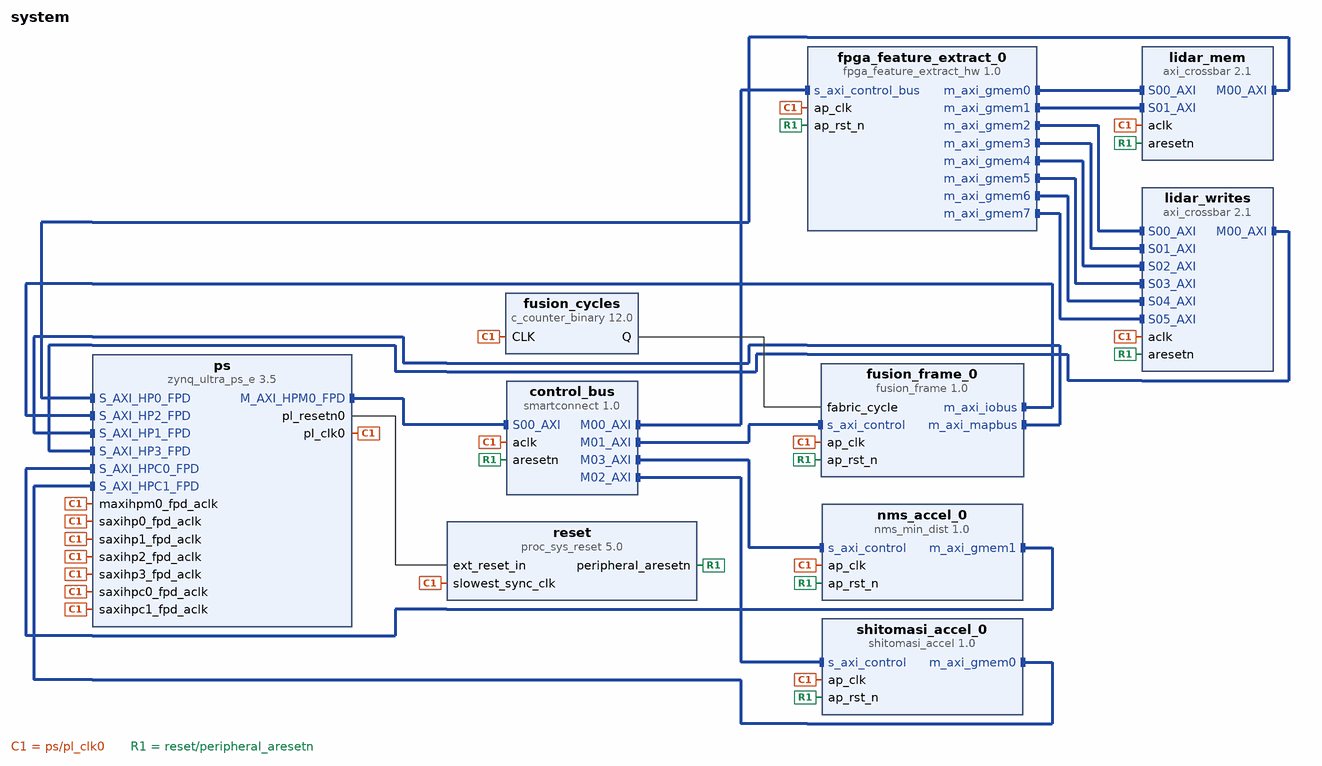
[diagram p0: block diagram of the top level]
# Vivado block design system, xck26-sfvc784-2LV-c, Vivado 2026.1
create_bd_design system

create_bd_cell -type ip -vlnv xilinx.com:ip:zynq_ultra_ps_e:3.5 ps
set_property -dict [list \
  CONFIG.PSU_BANK_0_IO_STANDARD LVCMOS18 \
  CONFIG.PSU_BANK_1_IO_STANDARD LVCMOS18 \
  CONFIG.PSU_BANK_2_IO_STANDARD LVCMOS18 \
  CONFIG.PSU_BANK_3_IO_STANDARD LVCMOS18 \
  CONFIG.PSU__CAN1__PERIPHERAL__ENABLE 0 \
  CONFIG.PSU__CRF_APB__ACPU_CTRL__FREQMHZ 1333.333 \
  CONFIG.PSU__CRF_APB__ACPU_CTRL__SRCSEL APLL \
  CONFIG.PSU__CRF_APB__APLL_CTRL__SRCSEL PSS_REF_CLK \
  CONFIG.PSU__CRF_APB__APLL_FRAC_CFG__ENABLED 1 \
  CONFIG.PSU__CRF_APB__DBG_FPD_CTRL__FREQMHZ 250 \
  CONFIG.PSU__CRF_APB__DBG_FPD_CTRL__SRCSEL IOPLL \
  CONFIG.PSU__CRF_APB__DBG_TRACE_CTRL__FREQMHZ 250 \
  CONFIG.PSU__CRF_APB__DBG_TRACE_CTRL__SRCSEL IOPLL \
  CONFIG.PSU__CRF_APB__DBG_TSTMP_CTRL__FREQMHZ 250 \
  CONFIG.PSU__CRF_APB__DBG_TSTMP_CTRL__SRCSEL IOPLL \
  CONFIG.PSU__CRF_APB__DDR_CTRL__FREQMHZ 1200 \
  CONFIG.PSU__CRF_APB__DDR_CTRL__SRCSEL DPLL \
  CONFIG.PSU__CRF_APB__DPDMA_REF_CTRL__FREQMHZ 600 \
  CONFIG.PSU__CRF_APB__DPDMA_REF_CTRL__SRCSEL APLL \
  CONFIG.PSU__CRF_APB__DPLL_CTRL__SRCSEL PSS_REF_CLK \
  CONFIG.PSU__CRF_APB__GDMA_REF_CTRL__FREQMHZ 600 \
  CONFIG.PSU__CRF_APB__GDMA_REF_CTRL__SRCSEL DPLL \
  CONFIG.PSU__CRF_APB__GPU_REF_CTRL__FREQMHZ 600 \
  CONFIG.PSU__CRF_APB__GPU_REF_CTRL__SRCSEL IOPLL \
  CONFIG.PSU__CRF_APB__TOPSW_LSBUS_CTRL__FREQMHZ 100 \
  CONFIG.PSU__CRF_APB__TOPSW_LSBUS_CTRL__SRCSEL IOPLL \
  CONFIG.PSU__CRF_APB__TOPSW_MAIN_CTRL__FREQMHZ 533.33 \
  CONFIG.PSU__CRF_APB__TOPSW_MAIN_CTRL__SRCSEL DPLL \
  CONFIG.PSU__CRF_APB__VPLL_CTRL__SRCSEL PSS_REF_CLK \
  CONFIG.PSU__CRL_APB__ADMA_REF_CTRL__FREQMHZ 500 \
  CONFIG.PSU__CRL_APB__ADMA_REF_CTRL__SRCSEL IOPLL \
  CONFIG.PSU__CRL_APB__CAN1_REF_CTRL__SRCSEL IOPLL \
  CONFIG.PSU__CRL_APB__CPU_R5_CTRL__FREQMHZ 533.333 \
  CONFIG.PSU__CRL_APB__CPU_R5_CTRL__SRCSEL RPLL \
  CONFIG.PSU__CRL_APB__DBG_LPD_CTRL__FREQMHZ 250 \
  CONFIG.PSU__CRL_APB__DBG_LPD_CTRL__SRCSEL IOPLL \
  CONFIG.PSU__CRL_APB__I2C1_REF_CTRL__FREQMHZ 100 \
  CONFIG.PSU__CRL_APB__I2C1_REF_CTRL__SRCSEL IOPLL \
  CONFIG.PSU__CRL_APB__IOPLL_CTRL__SRCSEL PSS_REF_CLK \
  CONFIG.PSU__CRL_APB__IOU_SWITCH_CTRL__FREQMHZ 250 \
  CONFIG.PSU__CRL_APB__IOU_SWITCH_CTRL__SRCSEL IOPLL \
  CONFIG.PSU__CRL_APB__LPD_LSBUS_CTRL__FREQMHZ 100 \
  CONFIG.PSU__CRL_APB__LPD_LSBUS_CTRL__SRCSEL IOPLL \
  CONFIG.PSU__CRL_APB__LPD_SWITCH_CTRL__FREQMHZ 500 \
  CONFIG.PSU__CRL_APB__LPD_SWITCH_CTRL__SRCSEL IOPLL \
  CONFIG.PSU__CRL_APB__PCAP_CTRL__FREQMHZ 200 \
  CONFIG.PSU__CRL_APB__PCAP_CTRL__SRCSEL IOPLL \
  CONFIG.PSU__CRL_APB__PL0_REF_CTRL__FREQMHZ 100 \
  CONFIG.PSU__CRL_APB__PL0_REF_CTRL__SRCSEL IOPLL \
  CONFIG.PSU__CRL_APB__PL1_REF_CTRL__SRCSEL IOPLL \
  CONFIG.PSU__CRL_APB__QSPI_REF_CTRL__FREQMHZ 125 \
  CONFIG.PSU__CRL_APB__QSPI_REF_CTRL__SRCSEL IOPLL \
  CONFIG.PSU__CRL_APB__RPLL_CTRL__SRCSEL PSS_REF_CLK \
  CONFIG.PSU__CRL_APB__SPI1_REF_CTRL__SRCSEL IOPLL \
  CONFIG.PSU__CRL_APB__TIMESTAMP_REF_CTRL__FREQMHZ 100 \
  CONFIG.PSU__CRL_APB__TIMESTAMP_REF_CTRL__SRCSEL IOPLL \
  CONFIG.PSU__CSUPMU__PERIPHERAL__VALID 1 \
  CONFIG.PSU__DDRC__BUS_WIDTH {64 Bit} \
  CONFIG.PSU__DDRC__COMPONENTS Components \
  CONFIG.PSU__DDRC__DEVICE_CAPACITY {8192 MBits} \
  CONFIG.PSU__DDRC__DRAM_WIDTH {16 Bits} \
  CONFIG.PSU__DDRC__ECC Disabled \
  CONFIG.PSU__DDRC__MEMORY_TYPE {DDR 4} \
  CONFIG.PSU__DDRC__SPEED_BIN DDR4_2400R \
  CONFIG.PSU__DDR_HIGH_ADDRESS_GUI_ENABLE 1 \
  CONFIG.PSU__DDR__INTERFACE__FREQMHZ 600.000 \
  CONFIG.PSU__FPGA_PL0_ENABLE 1 \
  CONFIG.PSU__FPGA_PL1_ENABLE 1 \
  CONFIG.PSU__GPIO0_MIO__IO {MIO 0 .. 25} \
  CONFIG.PSU__GPIO0_MIO__PERIPHERAL__ENABLE 1 \
  CONFIG.PSU__GPIO1_MIO__IO {MIO 26 .. 51} \
  CONFIG.PSU__GPIO1_MIO__PERIPHERAL__ENABLE 1 \
  CONFIG.PSU__I2C0__PERIPHERAL__ENABLE 0 \
  CONFIG.PSU__I2C1__PERIPHERAL__ENABLE 1 \
  CONFIG.PSU__I2C1__PERIPHERAL__IO {MIO 24 .. 25} \
  CONFIG.PSU__IOU_SLCR__IOU_TTC_APB_CLK__TTC0_SEL APB \
  CONFIG.PSU__IOU_SLCR__IOU_TTC_APB_CLK__TTC1_SEL APB \
  CONFIG.PSU__IOU_SLCR__IOU_TTC_APB_CLK__TTC2_SEL APB \
  CONFIG.PSU__IOU_SLCR__IOU_TTC_APB_CLK__TTC3_SEL APB \
  CONFIG.PSU__MAXIGP0__DATA_WIDTH 128 \
  CONFIG.PSU__OVERRIDE__BASIC_CLOCK 0 \
  CONFIG.PSU__PMU_COHERENCY 0 \
  CONFIG.PSU__PMU__AIBACK__ENABLE 0 \
  CONFIG.PSU__PMU__EMIO_GPI__ENABLE 0 \
  CONFIG.PSU__PMU__EMIO_GPO__ENABLE 0 \
  CONFIG.PSU__PMU__GPI0__ENABLE 1 \
  CONFIG.PSU__PMU__GPI0__IO {MIO 26} \
  CONFIG.PSU__PMU__GPI1__ENABLE 0 \
  CONFIG.PSU__PMU__GPI2__ENABLE 0 \
  CONFIG.PSU__PMU__GPI3__ENABLE 0 \
  CONFIG.PSU__PMU__GPI4__ENABLE 0 \
  CONFIG.PSU__PMU__GPI5__ENABLE 1 \
  CONFIG.PSU__PMU__GPI5__IO {MIO 31} \
  CONFIG.PSU__PMU__GPO0__ENABLE 0 \
  CONFIG.PSU__PMU__GPO1__ENABLE 0 \
  CONFIG.PSU__PMU__GPO2__ENABLE 0 \
  CONFIG.PSU__PMU__GPO3__ENABLE 1 \
  CONFIG.PSU__PMU__GPO3__IO {MIO 35} \
  CONFIG.PSU__PMU__GPO3__POLARITY low \
  CONFIG.PSU__PMU__GPO4__ENABLE 0 \
  CONFIG.PSU__PMU__GPO5__ENABLE 0 \
  CONFIG.PSU__PMU__PERIPHERAL__ENABLE 1 \
  CONFIG.PSU__PMU__PLERROR__ENABLE 0 \
  CONFIG.PSU__PRESET_APPLIED 1 \
  CONFIG.PSU__PSS_REF_CLK__FREQMHZ 33.333 \
  CONFIG.PSU__QSPI_COHERENCY 0 \
  CONFIG.PSU__QSPI_ROUTE_THROUGH_FPD 0 \
  CONFIG.PSU__QSPI__GRP_FBCLK__ENABLE 0 \
  CONFIG.PSU__QSPI__PERIPHERAL__DATA_MODE x4 \
  CONFIG.PSU__QSPI__PERIPHERAL__ENABLE 1 \
  CONFIG.PSU__QSPI__PERIPHERAL__IO {MIO 0 .. 5} \
  CONFIG.PSU__QSPI__PERIPHERAL__MODE Single \
  CONFIG.PSU__SAXIGP0__DATA_WIDTH 32 \
  CONFIG.PSU__SAXIGP1__DATA_WIDTH 32 \
  CONFIG.PSU__SAXIGP4__DATA_WIDTH 32 \
  CONFIG.PSU__SAXIGP5__DATA_WIDTH 32 \
  CONFIG.PSU__SPI1__GRP_SS0__IO {MIO 9} \
  CONFIG.PSU__SPI1__PERIPHERAL__ENABLE 1 \
  CONFIG.PSU__SPI1__PERIPHERAL__IO {MIO 6 .. 11} \
  CONFIG.PSU__SWDT0__CLOCK__ENABLE 0 \
  CONFIG.PSU__SWDT0__PERIPHERAL__ENABLE 1 \
  CONFIG.PSU__SWDT0__RESET__ENABLE 0 \
  CONFIG.PSU__SWDT1__CLOCK__ENABLE 0 \
  CONFIG.PSU__SWDT1__PERIPHERAL__ENABLE 1 \
  CONFIG.PSU__SWDT1__RESET__ENABLE 0 \
  CONFIG.PSU__TTC0__CLOCK__ENABLE 0 \
  CONFIG.PSU__TTC0__PERIPHERAL__ENABLE 1 \
  CONFIG.PSU__TTC0__WAVEOUT__ENABLE 0 \
  CONFIG.PSU__TTC1__CLOCK__ENABLE 0 \
  CONFIG.PSU__TTC1__PERIPHERAL__ENABLE 1 \
  CONFIG.PSU__TTC1__WAVEOUT__ENABLE 0 \
  CONFIG.PSU__TTC2__CLOCK__ENABLE 0 \
  CONFIG.PSU__TTC2__PERIPHERAL__ENABLE 1 \
  CONFIG.PSU__TTC2__WAVEOUT__ENABLE 0 \
  CONFIG.PSU__TTC3__CLOCK__ENABLE 0 \
  CONFIG.PSU__TTC3__PERIPHERAL__ENABLE 1 \
  CONFIG.PSU__TTC3__WAVEOUT__ENABLE 0 \
  CONFIG.PSU__USE__IRQ0 1 \
  CONFIG.PSU__USE__M_AXI_GP0 1 \
  CONFIG.PSU__USE__M_AXI_GP1 0 \
  CONFIG.PSU__USE__M_AXI_GP2 0 \
  CONFIG.PSU__USE__S_AXI_GP0 1 \
  CONFIG.PSU__USE__S_AXI_GP1 1 \
  CONFIG.PSU__USE__S_AXI_GP2 1 \
  CONFIG.PSU__USE__S_AXI_GP3 1 \
  CONFIG.PSU__USE__S_AXI_GP4 1 \
  CONFIG.PSU__USE__S_AXI_GP5 1 \
] [get_bd_cells ps]
# 246 more settings of ps are not shown: defaults, MIO pin electricals, DDR timing, and values the tool derives
create_bd_cell -type ip -vlnv xilinx.com:hls:fpga_feature_extract_hw:1.0 fpga_feature_extract_0
create_bd_cell -type ip -vlnv xilinx.com:hls:fusion_frame:1.0 fusion_frame_0
create_bd_cell -type ip -vlnv xilinx.com:ip:smartconnect:1.0 control_bus
set_property -dict {CONFIG.NUM_MI 4 CONFIG.NUM_SI 1} [get_bd_cells control_bus]
create_bd_cell -type ip -vlnv xilinx.com:ip:axi_crossbar:2.1 lidar_mem
set_property -dict [list \
  CONFIG.DATA_WIDTH 128 \
  CONFIG.M00_READ_ISSUING 16 \
  CONFIG.M00_WRITE_ISSUING 16 \
  CONFIG.NUM_MI 1 \
  CONFIG.NUM_SI 2 \
] [get_bd_cells lidar_mem]
create_bd_cell -type ip -vlnv xilinx.com:ip:axi_crossbar:2.1 lidar_writes
set_property -dict {CONFIG.DATA_WIDTH 32 CONFIG.M00_WRITE_ISSUING 16 CONFIG.NUM_MI 1 CONFIG.NUM_SI 6} [get_bd_cells lidar_writes]
create_bd_cell -type ip -vlnv xilinx.com:ip:proc_sys_reset:5.0 reset
create_bd_cell -type ip -vlnv user:hls:shitomasi_accel:1.0 shitomasi_accel_0
create_bd_cell -type ip -vlnv user:hls:nms_min_dist:1.0 nms_accel_0
create_bd_cell -type ip -vlnv xilinx.com:ip:c_counter_binary:12.0 fusion_cycles
set_property -dict {CONFIG.CE false CONFIG.Output_Width 32} [get_bd_cells fusion_cycles]

# ---- connections ----

connect_bd_intf_net [get_bd_intf_pins control_bus/M00_AXI] [get_bd_intf_pins fpga_feature_extract_0/s_axi_control_bus]
connect_bd_intf_net [get_bd_intf_pins control_bus/M01_AXI] [get_bd_intf_pins fusion_frame_0/s_axi_control]
connect_bd_intf_net [get_bd_intf_pins control_bus/M02_AXI] [get_bd_intf_pins shitomasi_accel_0/s_axi_control]
connect_bd_intf_net [get_bd_intf_pins control_bus/M03_AXI] [get_bd_intf_pins nms_accel_0/s_axi_control]
connect_bd_intf_net [get_bd_intf_pins fpga_feature_extract_0/m_axi_gmem0] [get_bd_intf_pins lidar_mem/S00_AXI]
connect_bd_intf_net [get_bd_intf_pins fpga_feature_extract_0/m_axi_gmem1] [get_bd_intf_pins lidar_mem/S01_AXI]
connect_bd_intf_net [get_bd_intf_pins fpga_feature_extract_0/m_axi_gmem2] [get_bd_intf_pins lidar_writes/S00_AXI]
connect_bd_intf_net [get_bd_intf_pins fpga_feature_extract_0/m_axi_gmem3] [get_bd_intf_pins lidar_writes/S01_AXI]
connect_bd_intf_net [get_bd_intf_pins fpga_feature_extract_0/m_axi_gmem4] [get_bd_intf_pins lidar_writes/S02_AXI]
connect_bd_intf_net [get_bd_intf_pins fpga_feature_extract_0/m_axi_gmem5] [get_bd_intf_pins lidar_writes/S03_AXI]
connect_bd_intf_net [get_bd_intf_pins fpga_feature_extract_0/m_axi_gmem6] [get_bd_intf_pins lidar_writes/S04_AXI]
connect_bd_intf_net [get_bd_intf_pins fpga_feature_extract_0/m_axi_gmem7] [get_bd_intf_pins lidar_writes/S05_AXI]
connect_bd_intf_net [get_bd_intf_pins fusion_frame_0/m_axi_iobus] [get_bd_intf_pins ps/S_AXI_HP2_FPD]
connect_bd_intf_net [get_bd_intf_pins fusion_frame_0/m_axi_mapbus] [get_bd_intf_pins ps/S_AXI_HP1_FPD]
connect_bd_intf_net [get_bd_intf_pins lidar_mem/M00_AXI] [get_bd_intf_pins ps/S_AXI_HP0_FPD]
connect_bd_intf_net [get_bd_intf_pins lidar_writes/M00_AXI] [get_bd_intf_pins ps/S_AXI_HP3_FPD]
connect_bd_intf_net [get_bd_intf_pins nms_accel_0/m_axi_gmem1] [get_bd_intf_pins ps/S_AXI_HPC0_FPD]
connect_bd_intf_net [get_bd_intf_pins ps/M_AXI_HPM0_FPD] [get_bd_intf_pins control_bus/S00_AXI]
connect_bd_intf_net [get_bd_intf_pins shitomasi_accel_0/m_axi_gmem0] [get_bd_intf_pins ps/S_AXI_HPC1_FPD]
connect_bd_net [get_bd_pins fusion_cycles/Q] [get_bd_pins fusion_frame_0/fabric_cycle]
connect_bd_net [get_bd_pins ps/pl_clk0] \
  [get_bd_pins ps/maxihpm0_fpd_aclk] [get_bd_pins ps/saxihp0_fpd_aclk] [get_bd_pins ps/saxihp1_fpd_aclk] \
  [get_bd_pins ps/saxihp2_fpd_aclk] [get_bd_pins ps/saxihp3_fpd_aclk] [get_bd_pins ps/saxihpc1_fpd_aclk] \
  [get_bd_pins lidar_writes/aclk] [get_bd_pins ps/saxihpc0_fpd_aclk] [get_bd_pins shitomasi_accel_0/ap_clk] \
  [get_bd_pins nms_accel_0/ap_clk] [get_bd_pins control_bus/aclk] [get_bd_pins lidar_mem/aclk] \
  [get_bd_pins reset/slowest_sync_clk] [get_bd_pins fpga_feature_extract_0/ap_clk] [get_bd_pins fusion_frame_0/ap_clk] \
  [get_bd_pins fusion_cycles/CLK]
connect_bd_net [get_bd_pins ps/pl_resetn0] [get_bd_pins reset/ext_reset_in]
connect_bd_net [get_bd_pins reset/peripheral_aresetn] \
  [get_bd_pins lidar_writes/aresetn] [get_bd_pins shitomasi_accel_0/ap_rst_n] [get_bd_pins nms_accel_0/ap_rst_n] \
  [get_bd_pins control_bus/aresetn] [get_bd_pins lidar_mem/aresetn] [get_bd_pins fpga_feature_extract_0/ap_rst_n] \
  [get_bd_pins fusion_frame_0/ap_rst_n]

# ---- address map ----
assign_bd_address -offset 0x0000000000000000 -range 2G -target_address_space [get_bd_addr_spaces fpga_feature_extract_0/Data_m_axi_gmem0] [get_bd_addr_segs ps/SAXIGP2/HP0_DDR_LOW]
assign_bd_address -offset 0x00000000C0000000 -range 512M -target_address_space [get_bd_addr_spaces fpga_feature_extract_0/Data_m_axi_gmem0] [get_bd_addr_segs ps/SAXIGP2/HP0_QSPI]
assign_bd_address -offset 0x0000000800000000 -range 32G -target_address_space [get_bd_addr_spaces fpga_feature_extract_0/Data_m_axi_gmem0] [get_bd_addr_segs ps/SAXIGP2/HP0_DDR_HIGH]
exclude_bd_addr_seg -offset 0x00000000FF000000 -range 16M -target_address_space [get_bd_addr_spaces fpga_feature_extract_0/Data_m_axi_gmem0] [get_bd_addr_segs ps/SAXIGP2/HP0_LPS_OCM]
assign_bd_address -offset 0x0000000000000000 -range 2G -target_address_space [get_bd_addr_spaces fpga_feature_extract_0/Data_m_axi_gmem1] [get_bd_addr_segs ps/SAXIGP2/HP0_DDR_LOW]
assign_bd_address -offset 0x00000000C0000000 -range 512M -target_address_space [get_bd_addr_spaces fpga_feature_extract_0/Data_m_axi_gmem1] [get_bd_addr_segs ps/SAXIGP2/HP0_QSPI]
assign_bd_address -offset 0x0000000800000000 -range 32G -target_address_space [get_bd_addr_spaces fpga_feature_extract_0/Data_m_axi_gmem1] [get_bd_addr_segs ps/SAXIGP2/HP0_DDR_HIGH]
exclude_bd_addr_seg -offset 0x00000000FF000000 -range 16M -target_address_space [get_bd_addr_spaces fpga_feature_extract_0/Data_m_axi_gmem1] [get_bd_addr_segs ps/SAXIGP2/HP0_LPS_OCM]
assign_bd_address -offset 0x0000000000000000 -range 2G -target_address_space [get_bd_addr_spaces fpga_feature_extract_0/Data_m_axi_gmem2] [get_bd_addr_segs ps/SAXIGP5/HP3_DDR_LOW]
assign_bd_address -offset 0x00000000C0000000 -range 512M -target_address_space [get_bd_addr_spaces fpga_feature_extract_0/Data_m_axi_gmem2] [get_bd_addr_segs ps/SAXIGP5/HP3_QSPI]
assign_bd_address -offset 0x0000000800000000 -range 32G -target_address_space [get_bd_addr_spaces fpga_feature_extract_0/Data_m_axi_gmem2] [get_bd_addr_segs ps/SAXIGP5/HP3_DDR_HIGH]
exclude_bd_addr_seg -offset 0x00000000FF000000 -range 16M -target_address_space [get_bd_addr_spaces fpga_feature_extract_0/Data_m_axi_gmem2] [get_bd_addr_segs ps/SAXIGP5/HP3_LPS_OCM]
assign_bd_address -offset 0x0000000000000000 -range 2G -target_address_space [get_bd_addr_spaces fpga_feature_extract_0/Data_m_axi_gmem3] [get_bd_addr_segs ps/SAXIGP5/HP3_DDR_LOW]
assign_bd_address -offset 0x00000000C0000000 -range 512M -target_address_space [get_bd_addr_spaces fpga_feature_extract_0/Data_m_axi_gmem3] [get_bd_addr_segs ps/SAXIGP5/HP3_QSPI]
assign_bd_address -offset 0x0000000800000000 -range 32G -target_address_space [get_bd_addr_spaces fpga_feature_extract_0/Data_m_axi_gmem3] [get_bd_addr_segs ps/SAXIGP5/HP3_DDR_HIGH]
exclude_bd_addr_seg -offset 0x00000000FF000000 -range 16M -target_address_space [get_bd_addr_spaces fpga_feature_extract_0/Data_m_axi_gmem3] [get_bd_addr_segs ps/SAXIGP5/HP3_LPS_OCM]
assign_bd_address -offset 0x0000000000000000 -range 2G -target_address_space [get_bd_addr_spaces fpga_feature_extract_0/Data_m_axi_gmem4] [get_bd_addr_segs ps/SAXIGP5/HP3_DDR_LOW]
assign_bd_address -offset 0x00000000C0000000 -range 512M -target_address_space [get_bd_addr_spaces fpga_feature_extract_0/Data_m_axi_gmem4] [get_bd_addr_segs ps/SAXIGP5/HP3_QSPI]
assign_bd_address -offset 0x0000000800000000 -range 32G -target_address_space [get_bd_addr_spaces fpga_feature_extract_0/Data_m_axi_gmem4] [get_bd_addr_segs ps/SAXIGP5/HP3_DDR_HIGH]
exclude_bd_addr_seg -offset 0x00000000FF000000 -range 16M -target_address_space [get_bd_addr_spaces fpga_feature_extract_0/Data_m_axi_gmem4] [get_bd_addr_segs ps/SAXIGP5/HP3_LPS_OCM]
assign_bd_address -offset 0x0000000000000000 -range 2G -target_address_space [get_bd_addr_spaces fpga_feature_extract_0/Data_m_axi_gmem5] [get_bd_addr_segs ps/SAXIGP5/HP3_DDR_LOW]
assign_bd_address -offset 0x00000000C0000000 -range 512M -target_address_space [get_bd_addr_spaces fpga_feature_extract_0/Data_m_axi_gmem5] [get_bd_addr_segs ps/SAXIGP5/HP3_QSPI]
assign_bd_address -offset 0x0000000800000000 -range 32G -target_address_space [get_bd_addr_spaces fpga_feature_extract_0/Data_m_axi_gmem5] [get_bd_addr_segs ps/SAXIGP5/HP3_DDR_HIGH]
exclude_bd_addr_seg -offset 0x00000000FF000000 -range 16M -target_address_space [get_bd_addr_spaces fpga_feature_extract_0/Data_m_axi_gmem5] [get_bd_addr_segs ps/SAXIGP5/HP3_LPS_OCM]
assign_bd_address -offset 0x0000000000000000 -range 2G -target_address_space [get_bd_addr_spaces fpga_feature_extract_0/Data_m_axi_gmem6] [get_bd_addr_segs ps/SAXIGP5/HP3_DDR_LOW]
assign_bd_address -offset 0x00000000C0000000 -range 512M -target_address_space [get_bd_addr_spaces fpga_feature_extract_0/Data_m_axi_gmem6] [get_bd_addr_segs ps/SAXIGP5/HP3_QSPI]
assign_bd_address -offset 0x0000000800000000 -range 32G -target_address_space [get_bd_addr_spaces fpga_feature_extract_0/Data_m_axi_gmem6] [get_bd_addr_segs ps/SAXIGP5/HP3_DDR_HIGH]
exclude_bd_addr_seg -offset 0x00000000FF000000 -range 16M -target_address_space [get_bd_addr_spaces fpga_feature_extract_0/Data_m_axi_gmem6] [get_bd_addr_segs ps/SAXIGP5/HP3_LPS_OCM]
assign_bd_address -offset 0x0000000000000000 -range 2G -target_address_space [get_bd_addr_spaces fpga_feature_extract_0/Data_m_axi_gmem7] [get_bd_addr_segs ps/SAXIGP5/HP3_DDR_LOW]
assign_bd_address -offset 0x00000000C0000000 -range 512M -target_address_space [get_bd_addr_spaces fpga_feature_extract_0/Data_m_axi_gmem7] [get_bd_addr_segs ps/SAXIGP5/HP3_QSPI]
assign_bd_address -offset 0x0000000800000000 -range 32G -target_address_space [get_bd_addr_spaces fpga_feature_extract_0/Data_m_axi_gmem7] [get_bd_addr_segs ps/SAXIGP5/HP3_DDR_HIGH]
exclude_bd_addr_seg -offset 0x00000000FF000000 -range 16M -target_address_space [get_bd_addr_spaces fpga_feature_extract_0/Data_m_axi_gmem7] [get_bd_addr_segs ps/SAXIGP5/HP3_LPS_OCM]
assign_bd_address -offset 0x0000000000000000 -range 2G -target_address_space [get_bd_addr_spaces fusion_frame_0/Data_m_axi_iobus] [get_bd_addr_segs ps/SAXIGP4/HP2_DDR_LOW]
assign_bd_address -offset 0x00000000C0000000 -range 512M -target_address_space [get_bd_addr_spaces fusion_frame_0/Data_m_axi_iobus] [get_bd_addr_segs ps/SAXIGP4/HP2_QSPI]
assign_bd_address -offset 0x0000000800000000 -range 32G -target_address_space [get_bd_addr_spaces fusion_frame_0/Data_m_axi_iobus] [get_bd_addr_segs ps/SAXIGP4/HP2_DDR_HIGH]
exclude_bd_addr_seg -offset 0x00000000FF000000 -range 16M -target_address_space [get_bd_addr_spaces fusion_frame_0/Data_m_axi_iobus] [get_bd_addr_segs ps/SAXIGP4/HP2_LPS_OCM]
assign_bd_address -offset 0x0000000000000000 -range 2G -target_address_space [get_bd_addr_spaces fusion_frame_0/Data_m_axi_mapbus] [get_bd_addr_segs ps/SAXIGP3/HP1_DDR_LOW]
assign_bd_address -offset 0x00000000C0000000 -range 512M -target_address_space [get_bd_addr_spaces fusion_frame_0/Data_m_axi_mapbus] [get_bd_addr_segs ps/SAXIGP3/HP1_QSPI]
assign_bd_address -offset 0x0000000800000000 -range 32G -target_address_space [get_bd_addr_spaces fusion_frame_0/Data_m_axi_mapbus] [get_bd_addr_segs ps/SAXIGP3/HP1_DDR_HIGH]
exclude_bd_addr_seg -offset 0x00000000FF000000 -range 16M -target_address_space [get_bd_addr_spaces fusion_frame_0/Data_m_axi_mapbus] [get_bd_addr_segs ps/SAXIGP3/HP1_LPS_OCM]
assign_bd_address -offset 0x0000000000000000 -range 2G -target_address_space [get_bd_addr_spaces nms_accel_0/Data_m_axi_gmem1] [get_bd_addr_segs ps/SAXIGP0/HPC0_DDR_LOW]
assign_bd_address -offset 0x00000000C0000000 -range 512M -target_address_space [get_bd_addr_spaces nms_accel_0/Data_m_axi_gmem1] [get_bd_addr_segs ps/SAXIGP0/HPC0_QSPI]
assign_bd_address -offset 0x0000000800000000 -range 32G -target_address_space [get_bd_addr_spaces nms_accel_0/Data_m_axi_gmem1] [get_bd_addr_segs ps/SAXIGP0/HPC0_DDR_HIGH]
exclude_bd_addr_seg -offset 0x00000000FF000000 -range 16M -target_address_space [get_bd_addr_spaces nms_accel_0/Data_m_axi_gmem1] [get_bd_addr_segs ps/SAXIGP0/HPC0_LPS_OCM]
assign_bd_address -offset 0x00A0000000 -range 64K -target_address_space [get_bd_addr_spaces ps/Data] [get_bd_addr_segs fpga_feature_extract_0/s_axi_control_bus/Reg]
assign_bd_address -offset 0x00A0010000 -range 64K -target_address_space [get_bd_addr_spaces ps/Data] [get_bd_addr_segs fusion_frame_0/s_axi_control/Reg]
assign_bd_address -offset 0x00A0020000 -range 64K -target_address_space [get_bd_addr_spaces ps/Data] [get_bd_addr_segs shitomasi_accel_0/s_axi_control/Reg]
assign_bd_address -offset 0x00A0030000 -range 64K -target_address_space [get_bd_addr_spaces ps/Data] [get_bd_addr_segs nms_accel_0/s_axi_control/Reg]
assign_bd_address -offset 0x0000000000000000 -range 2G -target_address_space [get_bd_addr_spaces shitomasi_accel_0/Data_m_axi_gmem0] [get_bd_addr_segs ps/SAXIGP1/HPC1_DDR_LOW]
assign_bd_address -offset 0x00000000C0000000 -range 512M -target_address_space [get_bd_addr_spaces shitomasi_accel_0/Data_m_axi_gmem0] [get_bd_addr_segs ps/SAXIGP1/HPC1_QSPI]
assign_bd_address -offset 0x0000000800000000 -range 32G -target_address_space [get_bd_addr_spaces shitomasi_accel_0/Data_m_axi_gmem0] [get_bd_addr_segs ps/SAXIGP1/HPC1_DDR_HIGH]
exclude_bd_addr_seg -offset 0x00000000FF000000 -range 16M -target_address_space [get_bd_addr_spaces shitomasi_accel_0/Data_m_axi_gmem0] [get_bd_addr_segs ps/SAXIGP1/HPC1_LPS_OCM]

validate_bd_design
save_bd_design
